# Altium schematic sheet power.SchDoc
size A4; SheetNumber: 2; SheetTotal: 5
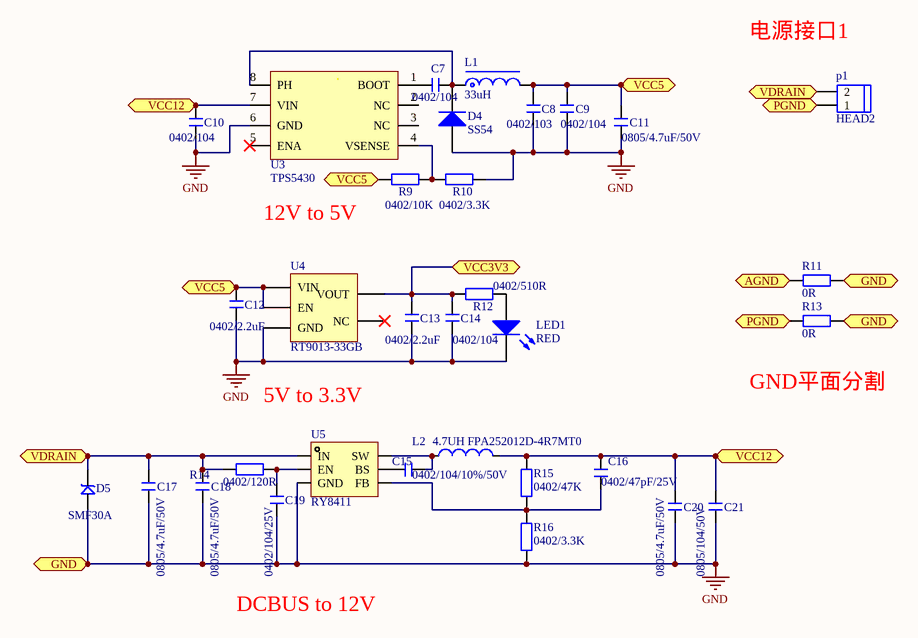
[diagram p0: power.SchDoc]

## Parts
C7  0402/104  [0402C]
C8  0402/103  [0402C]
C9  0402/104  [0402C]
C10  0402/104  [0402C]
C11  0805/4.7uF/50V  [0805C]
C12  0402/2.2uF  [0402C]
C13  0402/2.2uF  [0402C]
C14  0402/104  [0402C]
C15  0402/104/10%/50V  [0402C]
C16  0402/47pF/25V  [0402C]
C17  0805/4.7uF/50V  [0805C]
C18  0805/4.7uF/50V  [0805C]
C19  0402/104/25V  [0402C]
C20  0805/4.7uF/50V  [0805C]
C21  0805/104/50V  [0805C]
D4  SS54  [SMA]
D5  SMF30A  [SOD-123F]
L1  33uH  [CDRH73]
L2  4.7UH FPA252012D-4R7MT0  [NR2520]
LED1  RED  [LED 0603R]
p1  HEAD2  [KF301-5.0-2P]
R9  0402/10K  [0402R]
R10  0402/3.3K  [0402R]
R11  0R  [0603R]
R12  0402/510R  [0402R]
R13  0R  [0603R]
R14  0402/120R  [0402R]
R15  0402/47K  [0402R]
R16  0402/3.3K  [0402R]
U3  TPS5430  [SOIC-8-EP]
U4  RT9013-33GB  [SOT-23-5]
U5  RY8411  [SOT23-6]

## Ports
AGND (bidir), GND (bidir), PGND (bidir), VCC3V3 (bidir), VCC5 (bidir), VCC12 (bidir), VDRAIN (bidir)

## Nets
GND: C8.1 C9.1 C10.1 C11.1 C12.1 C13.1 C14.1 C17.1 C18.1 C19.1 C20.1 C21.1 D4.1(A) D5.2 LED1.2(K) R10.2 R11.2 R13.2 R16.1 U3.6(GND) U4.2(GND) U5.2(GND) ; port GND
AGND: R11.1 ; port AGND
PGND: p1.1 R13.1 ; port PGND
VCC3V3: C13.2 C14.2 R12.1 U4.5(VOUT) ; port VCC3V3
VCC5: C8.2 C9.2 C11.2 C12.2 L1.2 R9.1 U4.1(VIN) U4.3(EN) ; port VCC5
VCC12: C10.2 C16.2 C20.2 C21.2 L2.2 R15.2 U3.7(VIN) ; port VCC12
VDRAIN: C17.2 C18.2 D5.1 p1.2 R14.1 U5.5(IN) ; port VDRAIN
NetC7_1: C7.1 D4.2(K) L1.1 U3.8(PH)
NetC7_2: C7.2 U3.1(BOOT)
NetC15_1: C15.1 L2.1 U5.6(SW)
NetC15_2: C15.2 U5.1(BS)
NetC16_1: C16.1 R15.1 R16.2 U5.3(FB)
NetC19_2: C19.2 R14.2 U5.4(EN)
NetLED1_1: LED1.1(A) R12.2
NetR9_2: R9.2 R10.1 U3.4(VSENSE)

Not connected (* = marked no-connect by the designer): U3 2(NC) 3(NC) 5(ENA)* 9(pad); U4 4(NC)*

## Notes on the sheet
- 电源接口1
- 12V to 5V
- 5V to 3.3V
- (near R13) GND平面分割
- DCBUS to 12V

## Library data of the parts
C7 C9 C10 C14 = C: 贴片电容; value: 104; 嘉立创元件编号: C110251
C8 = C: 贴片电容; value: 103; 嘉立创元件编号: C15195
C11 C15-C21 = C: 贴片电容
  C11 C17 C18 C20: value: 4.7uF/50V; 嘉立创元件编号: C2991173
  C15: value: 104/10%/50V; 嘉立创元件编号: C110251
  C16: value: 47pF/25V; 嘉立创元件编号: C60137
  C19: value: 104/25V; 嘉立创元件编号: C110251
  C21: value: 104/50V; 嘉立创元件编号: C38141
C12 C13 = C: 贴片电容; value: 2.2uF; 嘉立创元件编号: C12530
D4 = SS54(DO-214AC ): 续流二极管; 嘉立创元件编号: C7420369
D5 = SMF30A: TVS二极管 静电和浪涌保护 30V; 嘉立创元件编号: C19077518
L1 = L-CDRH: 功率屏蔽电感; BOM名称: 功率屏蔽电感; 嘉立创元件编号: C5339524
L2 = L: 小功率贴片电感; 嘉立创元件编号: C5289265
LED1 = LED: RED 蓝、红; 嘉立创元件编号: C125100
p1 = HEAD2: 接线端子2P; 嘉立创元件编号: C474881
R9 = R: 贴片电阻; value: 10K; 嘉立创元件编号: C25744
R10 R16 = R: 贴片电阻; value: 3.3K; 嘉立创元件编号: C25890
R11 R13 = R: 贴片电阻 0603; BOM名称: 贴片电阻; 嘉立创元件编号: C2906974
R12 = R: 贴片电阻; value: 510R; 嘉立创元件编号: C25123
R14 = R: 贴片电阻; value: 120R; 嘉立创元件编号: C2909315
R15 = R: 贴片电阻; value: 47K; 嘉立创元件编号: C25792
U3 = TPS5430: DCDC开关电源芯片; 嘉立创元件编号: C9864
U4 = RT9013-33GB: LDO 5V TO 3.3V; 嘉立创元件编号: C47773
U5 = RY8411: DCDC降压芯片 42V输入 1.2A; 嘉立创元件编号: C2935411